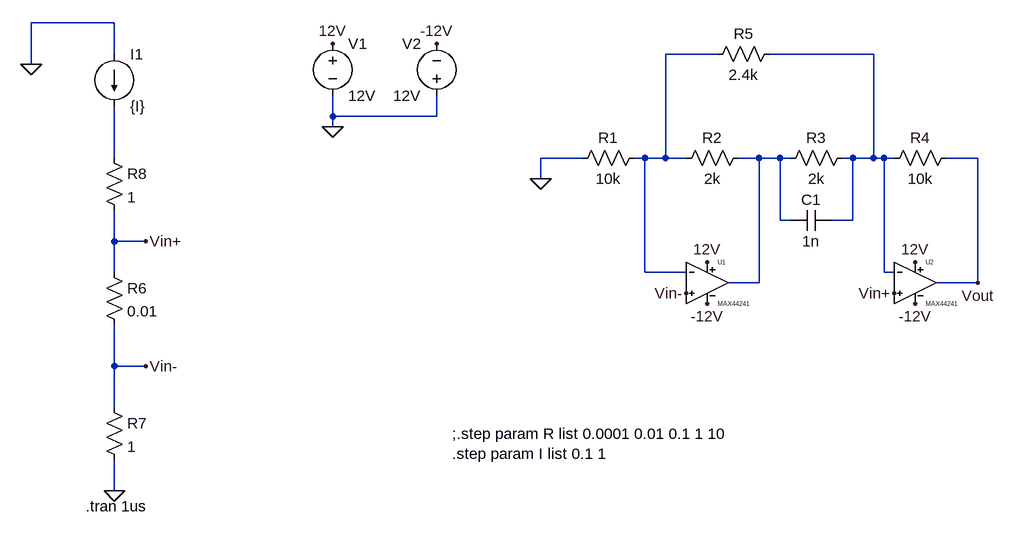
[diagram p0: schematic dc_load_current_sense.asc]
dc_load_current_sense.asc, the LTspice schematic file:
Version 4
SHEET 1 880 680
WIRE -624 -224 -752 -224
WIRE -624 -176 -624 -224
WIRE 304 -176 224 -176
WIRE 544 -176 384 -176
WIRE -752 -160 -752 -224
WIRE -288 -80 -288 -112
WIRE -128 -80 -128 -112
WIRE -128 -80 -288 -80
WIRE -288 -64 -288 -80
WIRE -624 -16 -624 -96
WIRE 96 -16 32 -16
WIRE 192 -16 176 -16
WIRE 224 -16 224 -176
WIRE 224 -16 192 -16
WIRE 256 -16 224 -16
WIRE 368 -16 336 -16
WIRE 400 -16 368 -16
WIRE 416 -16 400 -16
WIRE 512 -16 496 -16
WIRE 544 -16 544 -176
WIRE 544 -16 512 -16
WIRE 560 -16 544 -16
WIRE 576 -16 560 -16
WIRE 704 -16 656 -16
WIRE 32 16 32 -16
WIRE 400 80 400 -16
WIRE 416 80 400 80
WIRE 512 80 512 -16
WIRE 512 80 480 80
WIRE -624 112 -624 64
WIRE -576 112 -624 112
WIRE -624 160 -624 112
WIRE 192 160 192 -16
WIRE 256 160 192 160
WIRE 560 160 560 -16
WIRE 576 160 560 160
WIRE 368 176 368 -16
WIRE 368 176 320 176
WIRE 704 176 704 -16
WIRE 704 176 640 176
WIRE -624 304 -624 240
WIRE -576 304 -624 304
WIRE -624 368 -624 304
WIRE -624 496 -624 448
FLAG -288 -64 0
FLAG -288 -192 12V
FLAG -128 -192 -12V
FLAG 288 144 12V
FLAG 608 144 12V
FLAG 288 208 -12V
FLAG 608 208 -12V
FLAG 32 16 0
FLAG 704 176 Vout
FLAG 256 192 Vin-
FLAG 576 192 Vin+
FLAG -624 496 0
FLAG -576 304 Vin-
FLAG -576 112 Vin+
FLAG -752 -160 0
SYMBOL my\\MAX44241 288 112 R0
SYMATTR InstName U1
SYMBOL my\\MAX44241 608 112 R0
SYMATTR InstName U2
SYMBOL voltage -288 -208 R0
WINDOW 123 0 0 Left 2
WINDOW 39 0 0 Left 2
SYMATTR InstName V1
SYMATTR Value 12V
SYMBOL voltage -128 -96 R180
WINDOW 0 24 96 Left 2
WINDOW 3 24 16 Left 2
WINDOW 123 0 0 Left 2
WINDOW 39 0 0 Left 2
SYMATTR InstName V2
SYMATTR Value 12V
SYMBOL res 192 -32 R90
WINDOW 0 0 56 VBottom 2
WINDOW 3 32 56 VTop 2
SYMATTR InstName R1
SYMATTR Value 10k
SYMBOL res 352 -32 R90
WINDOW 0 0 56 VBottom 2
WINDOW 3 32 56 VTop 2
SYMATTR InstName R2
SYMATTR Value 2k
SYMBOL res 512 -32 R90
WINDOW 0 0 56 VBottom 2
WINDOW 3 32 56 VTop 2
SYMATTR InstName R3
SYMATTR Value 2k
SYMBOL res 672 -32 R90
WINDOW 0 0 56 VBottom 2
WINDOW 3 32 56 VTop 2
SYMATTR InstName R4
SYMATTR Value 10k
SYMBOL res 400 -192 R90
WINDOW 0 0 56 VBottom 2
WINDOW 3 32 56 VTop 2
SYMATTR InstName R5
SYMATTR Value 2.4k
SYMBOL cap 480 64 R90
WINDOW 0 0 32 VBottom 2
WINDOW 3 32 32 VTop 2
SYMATTR InstName C1
SYMATTR Value 1n
SYMBOL current -624 -176 R0
WINDOW 123 0 0 Left 2
WINDOW 39 0 0 Left 2
SYMATTR InstName I1
SYMATTR Value {I}
SYMBOL res -640 144 R0
SYMATTR InstName R6
SYMATTR Value 0.01
SYMBOL res -640 352 R0
SYMATTR InstName R7
SYMATTR Value 1
SYMBOL res -640 -32 R0
SYMATTR InstName R8
SYMATTR Value 1
TEXT -668 520 Left 2 !.tran 1us
TEXT -104 408 Left 2 !;.step param R list 0.0001 0.01 0.1 1 10\n.step param I list 0.1 1

The netlist it stands for:
* dc_load_current_sense.asc
XU1 Vin- N001 12V -12V N004 MAX44241  ; pins INA+ INA- VDD VSS OUTA
XU2 Vin+ N002 12V -12V Vout MAX44241  ; pins INA+ INA- VDD VSS OUTA
V1 12V 0 12V
V2 0 -12V 12V
R1 N001 0 10k
R2 N004 N001 2k
R3 N002 N004 2k
R4 Vout N002 10k
R5 N002 N001 2.4k
C1 N002 N004 1n
I1 0 N003 {I}
R6 Vin+ Vin- 0.01
R7 Vin- 0 1
R8 N003 Vin+ 1
.tran 1us
;.step param R list 0.0001 0.01 0.1 1 10
.step param I list 0.1 1
.lib MAX44241.lib
.backanno
.end